# Altium schematic sheet Connector_Sheet.SchDoc
size 420 x 297 mm; SheetNumber: 5; SheetTotal: 5
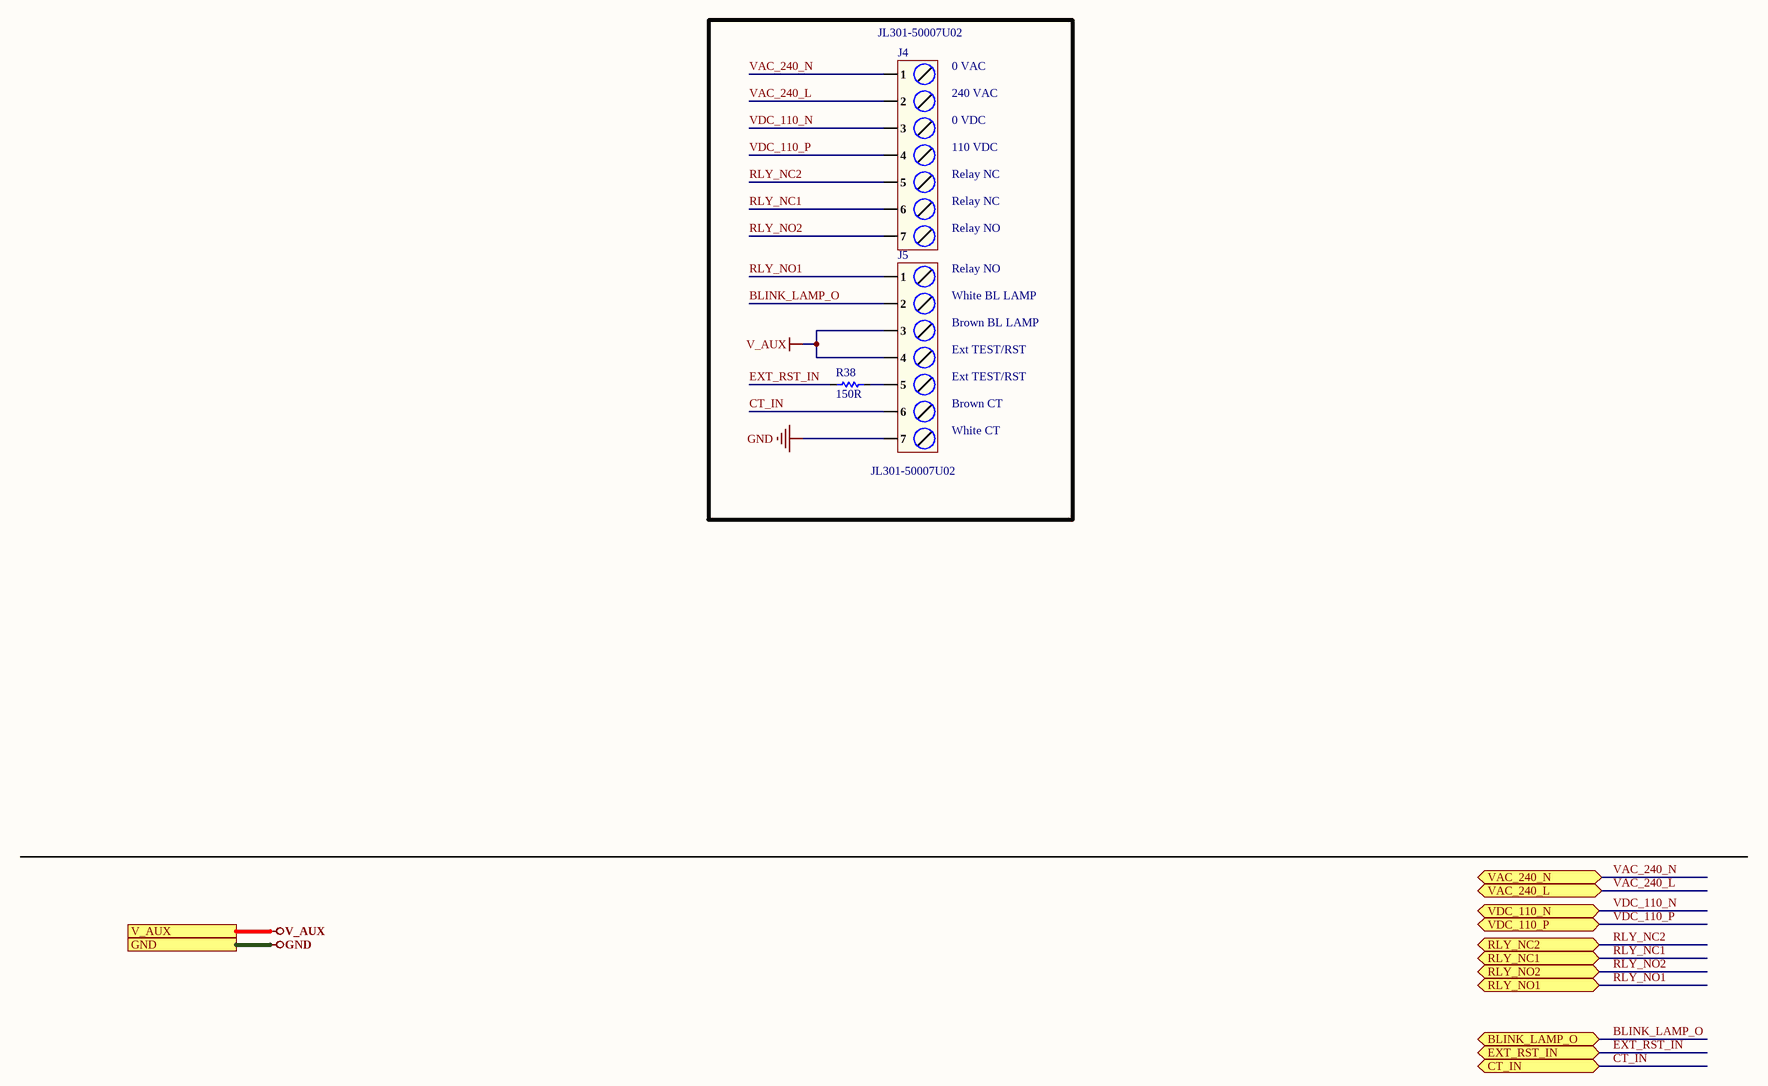
[diagram p0: Connector_Sheet.SchDoc]

## Parts
J4  JL301-50007U02  [JL301-50007U02]
J5  JL301-50007U02  [JL301-50007U02]
R38  150R  [Res-1206]

## Ports
BLINK_LAMP_O (bidir, see Top-Sheet[5B], Peripheral_Sheet[4D]), CT_IN (bidir, see Top-Sheet[5B], Peripheral_Sheet[4D]), EXT_RST_IN (bidir, see Top-Sheet[5B], Peripheral_Sheet[4D]), GND (see Top-Sheet[5A], Controller_Sheet[1D], Peripheral_Sheet[1D], Power_Sheet[1D]), RLY_NC1 (bidir, see Top-Sheet[5B], Peripheral_Sheet[4D]), RLY_NC2 (bidir, see Top-Sheet[5B], Peripheral_Sheet[4D]), RLY_NO1 (bidir, see Top-Sheet[5B], Peripheral_Sheet[4D]), RLY_NO2 (bidir, see Top-Sheet[5B], Peripheral_Sheet[4D]), V_AUX (see Top-Sheet[5A], Peripheral_Sheet[1D], Power_Sheet[1D]), VAC_240_L (bidir, see Top-Sheet[5B], Peripheral_Sheet[4D]), VAC_240_N (bidir, see Top-Sheet[5B], Peripheral_Sheet[4D]), VDC_110_N (bidir, see Top-Sheet[5B], Peripheral_Sheet[4D]), VDC_110_P (bidir, see Top-Sheet[5B], Peripheral_Sheet[4D])

## Nets
GND: J5.7 ; port GND
V_AUX: J5.3 J5.4 ; port V_AUX
BLINK_LAMP_O: J5.2 ; port BLINK_LAMP_O
CT_IN: J5.6 ; port CT_IN
EXT_RST_IN: R38.1 ; port EXT_RST_IN
RLY_NC1: J4.6 ; port RLY_NC1
RLY_NC2: J4.5 ; port RLY_NC2
RLY_NO1: J5.1 ; port RLY_NO1
RLY_NO2: J4.7 ; port RLY_NO2
VAC_240_L: J4.2 ; port VAC_240_L
VAC_240_N: J4.1 ; port VAC_240_N
VDC_110_N: J4.3 ; port VDC_110_N
VDC_110_P: J4.4 ; port VDC_110_P
NetJ5_5: J5.5 R38.2

## Notes on the sheet
- 0 VAC
- 0 VDC
- 240 VAC
- Relay NC
- 110 VDC
- Relay NO
- Brown BL LAMP
- White BL LAMP
- Brown CT
- Ext TEST/RST
- White CT
- Reflect Ein Technology Labs Sdn Bhd
- File:
- Title:
- Date:
- Page
- Num:
- Total:
- Drawn By: Nabil bin Feisal Bamadhaj

## Library data of the parts
J4 J5 = JL301-50007U02: 1x7P -40℃~+105℃ 15A 300V Blue 12~24 Direct Insert 5mm 1 7 Plugin,P=5mm Screw Terminal Blocks ROHS; Manufacturer: JILN; Manufacturer Part Number: JL301-50007U02; Package: Plugin,P=5mm; LCSC Part Number: C409139; Item Type: Screw Terminal; ComponentLink1Description: LCSC; ComponentLink1URL: https://www.lcsc.com/product-detail/Screw-Terminal-Blocks_JILN-JL301-50007U02_C409139.html
R38 = FRC1206F1500TS: 250mW Thick Film Resistors 200V ±100ppm/℃ ±1% 150Ω 1206 Chip Resistor - Surface Mount ROHS; Manufacturer: FOJAN; Manufacturer Part Number: FRC1206F1500TS; Package: 1206; LCSC Part Number: C2933598; Item Type: Resistor; ComponentLink1Description: LCSC; ComponentLink1URL: https://www.lcsc.com/product-detail/Chip-Resistor-Surface-Mount_FOJAN-FRC1206F1500TS_C2933598.html